# EasyEDA Pro project EVA_RT.eprj, board USB_Converter_PCB
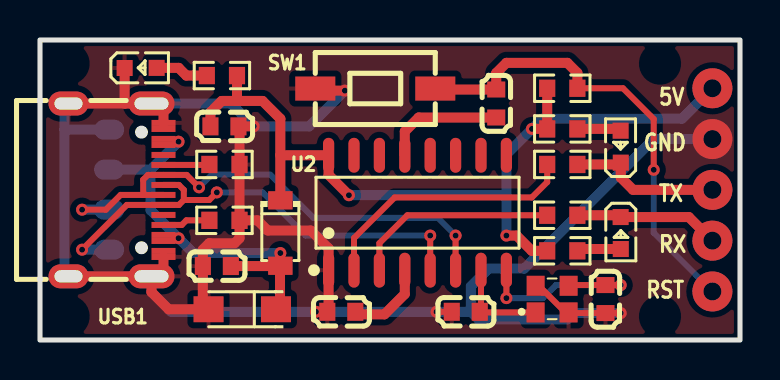
[diagram p8: board, top side]
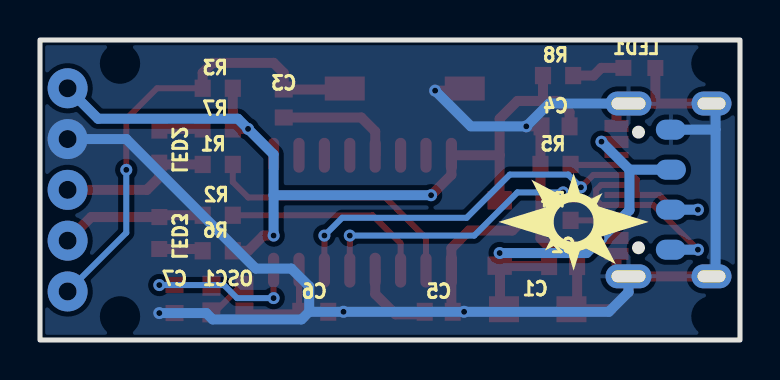
[diagram p9: board, bottom side, seen from below]

Outline 35 x 15 mm; copper layers: Top Layer, Bottom Layer. Coordinates in mm from the lower left corner of the outline.
Outline path: rectangle 0,15 35,0
Stack: Top Layer 0.035mm - / Dielectric1 1.51mm FR4 er 4.5 / Bottom Layer 0.035mm -

## Design rules (mm)
template: Custom Config
spacing copperThickness1oz (default): track to track 0.102, other pairs 0.152 to 0.3
spacing copperThickness2oz: track to track 0.203, other pairs 0.152 to 0.3
track width copperThickness1oz (default): min 0.127, default 0.254, max 2.54
track width copperThickness2oz: min 0.203, default 0.254, max 2.54
differential pair differentialPair (default): width min 0.127, default 0.254, max 2.54; gap min 0.152, default 0.152
via viaSize (default): diameter min 0.5, default 0.61, max 10; hole min 0.3, default 0.305, max 6.3
pour e1341 uses copperRegion1

## Placement (name value [footprint] x y rotation side)
C1  47uF  [CAP-SMD_L3.2-W1.6-RD]  10.11 1.54 180 top
C2  100nF  [C0603]  8.84 3.7 180 top
C3  100nF  [C0603]  22.81 11.83 270 top
C4  100nF  [C0603]  9.22 10.68 180 top
C5  100nF  [C0603]  15.06 1.41 180 top
C6  100nF  [C0603]  21.29 1.41 180 top
C7  100nF  [C0603]  28.27 2.05 90 top
D1  SBR0560S1-7  [SOD-123_L2.7-W1.6-LS3.7-RD]  12.02 5.35 270 top
LED1  XL-1608SURC-06  [LED0603-RD_RED]  5.03 13.6 0 top
LED2  XL-1608SURC-06  [LED0603-RD_RED]  29.03 9.67 90 top
LED3  XL-1608SURC-06  [LED0603-RD_RED]  29.03 5.35 270 top
NOREF  -  [Pad_e1199]  3.46 10.52 90 top
NOREF#2  -  [Pad_e1196]  3.46 4.52 90 top
NOREF#3  -  [Pad_e1197]  3.46 6.52 90 top
NOREF#4  -  [Pad_e1198]  3.46 8.52 90 top
OSC1  DSC6001JI1A-012.0000  [OSC-SMD_4P-L2.5-W2.0-BL-A]  25.61 2.05 0 top
R1  1kΩ  [R0603]  26.11 8.78 0 top
R2  1kΩ  [R0603]  26.11 6.24 0 top
R3  1kΩ  [R0603]  26.11 12.59 0 top
R4  5.1KΩ  [R0603]  9.22 5.98 180 top
R5  5.1KΩ  [R0603]  9.22 8.78 0 top
R6  1kΩ  [R0603]  26.11 4.46 0 top
R7  1kΩ  [R0603]  26.11 10.56 0 top
R8  1kΩ  [R0603]  9.1 13.22 180 top
SW1  TS-1101A-C-R  [SW-SMD_L6.00-W3.60-LS6.0]  16.76 12.57 180 top
U2  CH340C  [SOP-16_L10.0-W3.9-P1.27-LS6.0-BL]  18.88 6.36 0 top
USB1  UB1611-HGN  [usb-c-smd_gangyuan_ub1611-hgn]  3.8 7.5 270 top

## Footprints (pads in the part's own frame, mm; a bottom-side part is the same pattern mirrored in y, then rotated)
C0603
  rect 0.8x0.9 smd: 1(-0.7,0) 2(0.7,0)
CAP-SMD_L3.2-W1.6-RD
  rect 1.5x1.296 smd: 1(-1.687,0) 2(1.687,0)
LED0603-RD_RED
  rect 0.8x0.8 smd: 1(-0.799,-0.004) 2(0.799,0.004)
OSC-SMD_4P-L2.5-W2.0-BL-A
  rect 0.9x1 smd: 1(-0.825,-0.665) 2(0.825,-0.665) 3(0.825,0.665) 4(-0.825,0.665)
Pad_e1196
  oval 1x1.5 smd far side: 33(0,0)
Pad_e1197
  oval 1x1.5 smd far side: 33(0,0)
Pad_e1198
  oval 1x1.5 smd far side: 33(0,0)
Pad_e1199
  oval 1x1.5 smd far side: 33(0,0)
R0603
  rect 0.806x0.864 smd: 1(-0.753,0) 2(0.753,0)
SOD-123_L2.7-W1.6-LS3.7-RD
  rect 0.91x1.22 smd: 1(-1.635,0) 2(1.635,0)
SOP-16_L10.0-W3.9-P1.27-LS6.0-BL
  oval 0.56x1.745 smd: 1(-4.445,-2.873) 2(-3.175,-2.873) 3(-1.905,-2.873) 4(-0.635,-2.873) 5(0.635,-2.873) 6(1.905,-2.873) 7(3.175,-2.873) 8(4.445,-2.873) 9(4.445,2.873) 10(3.175,2.873) 11(1.905,2.873) 12(0.635,2.873) 13(-0.635,2.873) 14(-1.905,2.873) 15(-3.175,2.873) 16(-4.445,2.873)
SW-SMD_L6.00-W3.60-LS6.0
  rect 2x1.2 smd: 1(-3,0) 2(3,0)
usb-c-smd_gangyuan_ub1611-hgn
  oval 1.2x2.3 hole 0.6x1.7: 25(4.32,1.775) 28(-4.32,1.775)
  oval 1.2x2 hole 0.6x1.4: 26(4.32,-2.375) 27(-4.32,-2.375)
  rect 0.3x1.2 smd: A1(-3.35,2.375) A4(-2.55,2.375) A5(-1.25,2.375) A6(-0.25,2.375) A7(0.25,2.375) A8(1.25,2.375) A9(2.55,2.375) A12(3.35,2.375) B1(3.05,2.375) B4(2.25,2.375) B5(1.75,2.375) B6(0.75,2.375) B7(-0.75,2.375) B8(-1.75,2.375) B9(-2.25,2.375) B12(-3.05,2.375)

## Nets
As in the schematic, except:
+5VU: C1.1 C2.1 D1.2 NOREF#4.33 USB1.A9
GND: C1.2 C2.2 C4.1 C5.2 C6.2 C7.1 LED1.1 NOREF.33 OSC1.2 OSC1.4 R4.1 R5.2 SW1.2 U2.1 USB1.25 USB1.26 USB1.27 USB1.28 USB1.A1 USB1.A12 USB1.B1 USB1.B12
UD+: NOREF#2.33 U2.5 USB1.A6 USB1.B6
UD-: NOREF#3.33 U2.6 USB1.A7 USB1.B7

Pads without a net: U2 9 10 11 12 14 15; USB1 A8 B8

## Via types
v1: diameter 0.6, hole 0.3, Top Layer to Bottom Layer, 20 vias
v2: diameter 2, hole 0.9, Top Layer to Bottom Layer, 5 vias

## Routing (per net, layer and track width the routed paths; a pad name or vN(x,y) marks a point on that pad's centre or on a via; arc(x,y) is an arc through that point)
+3.3V: length 4.1
  Top Layer w0.5: 15.76,1.28 17.22,1.28 18.24,2.3 U2.4
+5V: length 43.7
  Top Layer w0.5: R3.1 R7.1 v1(24.6,10.56) ; 12.02,9.24 12.02,11.06 11.13,11.95 9.85,11.95 ; 12.02,9.24 U2.16 14.43,8.25 v1(15.45,7.24) ; 12.02,9.24 D1.1 ; R6.1 24.59,4.46 23.83,5.22 v1(23.32,5.22) ; C4.2 8.52,11.39 9.09,11.95 9.85,11.95 ; 9.85,11.95 R8.1
  Bottom Layer w0.5: v2(33.62,12.59) 32.1,11.06 25.11,11.06 v1(24.6,10.56) 23.32,9.28 23.32,7.24 ; 23.32,7.24 v1(23.32,5.22) ; 23.32,7.24 v1(15.45,7.24)
+5VU: length 19.1
  Top Layer w0.5: C2.1 12,3.7 ; 12,3.7 12,1.54 11.67,1.54 ; 12,3.7 12,4.33 v1(12.02,4.35)
  Bottom Layer w0.5: 5.53,8.52 v1(6.93,9.92) ; 5.53,8.52 5.53,6.49 v1(6.93,5.09) 7.67,4.35 v1(12.02,4.35) ; 5.53,8.52 NOREF#4.33
GND: length 107.8
  Top Layer w0.3: OSC1.4 24.94,2.71 26.27,1.38 26.43,1.38 26.47,1.35 C7.1 v1(29.03,1.35) ; v1(19.83,1.41) C6.2
  Top Layer w0.5: 4.23,11.82 USB1.27 ; 4.23,11.82 USB1.28 6.18,11.82 USB1.A1 ; 4.23,11.82 LED1.1 ; R4.1 R5.2 9.98,10.68 v1(10.69,10.68) ; R4.1 9.98,5.09 9.73,4.84 8.46,4.84 8.14,4.52 C2.2 8.14,1.54 ; R4.1 10.87,5.98 11.38,5.47 13.54,5.47 14.43,4.59 U2.1 14.43,1.41 v1(13.79,1.41) ; USB1.26 USB1.25 ; USB1.25 6.18,3.18 USB1.A12 ; USB1.25 5.57,2.39 6.43,1.54 8.14,1.54 ; 8.14,1.54 8.3,1.54 ; v1(15.24,12.47) 13.85,12.47
  Bottom Layer w0.5: v1(29.03,1.35) 26.68,1.35 26.37,1.03 21.92,1.03 21.54,1.41 ; NOREF.33 1.22,10.52 ; 1.22,10.52 1.22,11.82 USB1.27 ; 1.22,10.52 1.22,3.18 USB1.26 ; USB1.25 5.57,2.39 6.56,1.41 v1(13.79,1.41) v1(19.83,1.41) 21.54,1.41 ; v1(15.24,12.47) 13.46,10.68 v1(10.69,10.68) 9.54,11.82 USB1.28 ; v2(33.62,10.05) 30.69,10.05 24.21,3.57 22.43,3.57 21.54,2.68 21.54,1.41
$C3_2: length 6.1
  Top Layer w0.5: C3.2 18.94,11.12 18.24,10.43 U2.13
$C6_1: length 4.9
  Top Layer w0.3: U2.7 22.05,1.47 C6.1 22.02,1.38 OSC1.1
$C7_2: length 10
  Top Layer w0.3: 26.43,2.71 26.47,2.75 C7.2 v1(29.03,2.75) ; v1(23.32,2.09) U2.8
  Bottom Layer w0.3: v1(23.32,2.09) 25.15,2.09 25.8,2.75 v1(29.03,2.75)
$LED1_2: length 2.7
  Top Layer w0.5: LED1.2 6.93,13.61 7.32,13.22 R8.2
$LED2_2: length 2.2
  Top Layer w0.5: LED2.2 28.94,10.56 R7.2
$LED3_2: length 2.2
  Top Layer w0.5: LED3.2 26.96,4.55 R6.2
$R4_2: length 2.4
  Top Layer w0.3: USB1.B5 7.09,5.75 7.32,5.98 R4.2
$R5_1: length 2.3
  Top Layer w0.3: R5.1 8.45,8.75 USB1.A5
RESET: length 22.9
  Top Layer w0.3: v1(30.69,8.51) 30.69,11.05 29.15,12.59 R3.2
  Top Layer w0.5: C3.1 22.81,13.35 23.32,13.86 26.37,13.86 26.87,13.36 R3.2 ; C3.1 20.4,12.53 ; C3.1 22.94,12.53
  Bottom Layer w0.3: v2(33.62,2.43) 30.69,5.36 v1(30.69,8.51)
RX: length 10.3
  Top Layer w0.3: R2.1 18.37,6.24 16.97,4.84 U2.3
RX/D0: length 7.8
  Top Layer w0.5: R1.2 28.95,8.78 LED2.1 29.04,8.12 29.66,7.51 v2(33.62,7.51)
TX: length 13.3
  Top Layer w0.3: U2.2 15.7,5.09 17.73,7.13 24.59,7.13 25.36,7.9 R1.1
TX/D1: length 7.3
  Top Layer w0.5: R2.2 28.94,6.24 LED3.1 32.44,6.15 v2(33.62,4.97)
UD+: length 24.2
  Top Layer w0.3: 7.19,7 6.94,6.75 USB1.B6 4.34,6.75 v1(2.1,4.52) ; 7.19,7 8.46,7 v1(8.84,7.38) ; 7.19,7 7.19,7.51 6.94,7.75 USB1.A6 ; U2.5 v1(19.51,5.22)
  Bottom Layer w0.3: v1(19.51,5.22) 13.29,5.22 11.13,7.38 v1(8.84,7.38)
  Bottom Layer w0.5: v1(2.1,4.52) NOREF#2.33
UD-: length 25.7
  Top Layer w0.3: 5.16,7.25 5.16,8.02 5.4,8.25 USB1.B7 7.33,8.25 v1(7.95,7.63) ; 5.16,7.25 USB1.A7 ; 5.16,7.25 4.03,7.25 3.29,6.52 v1(2.1,6.52) ; v1(20.78,5.22) U2.6
  Bottom Layer w0.3: v1(7.95,7.63) 8.59,8.27 11.51,8.27 13.67,6.11 19.89,6.11 v1(20.78,5.22)
  Bottom Layer w0.5: v1(2.1,6.52) NOREF#3.33

## Copper pours and planes (outline as drawn; the poured copper is in the pictures)
GND on Top Layer: 0,15 35,15 35,0 0,0
GND on Bottom Layer: 0,15 35,15 35,0 0,0

## Text on the board
Top Silkscreen Layer: GND | RST | 5V | TX | RX
